# Altium schematic sheet Interfaces.SchDoc
size A3; SheetNumber: 11; SheetTotal: 11
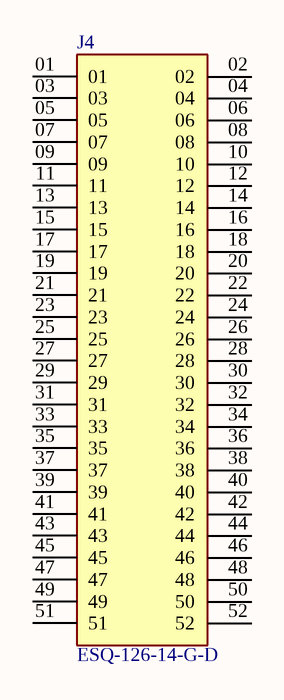
[diagram p0: Interfaces.SchDoc]

## Parts
J4  ESQ-126-14-G-D  [SAMTEC_ESQ-126-14-G-D]

## Nets

Not connected (* = marked no-connect by the designer): J4 01 02 03 04 05 06 07 08 09 10 11 12 13 14 15 16 17 18 19 20 21 22 23 24 25 26 27 28 29 30 31 32 33 34 35 36 37 38 39 40 41 42 43 44 45 46 47 48 49 50 51 52

## Library data of the parts
J4 = CMP-059-000000-1: MF: Samtec; Price: None; Value: *; Design Item ID: ESQ-126-14-G-D; Package: None; Source: SnapEDAsch.SchLib; MP: ESQ-126-14-G-D; Availability: Unavailable; Component Type: Standard; Pin Count: 52